# EAGLE schematic Esquema control final (EAGLE 9.7.0)
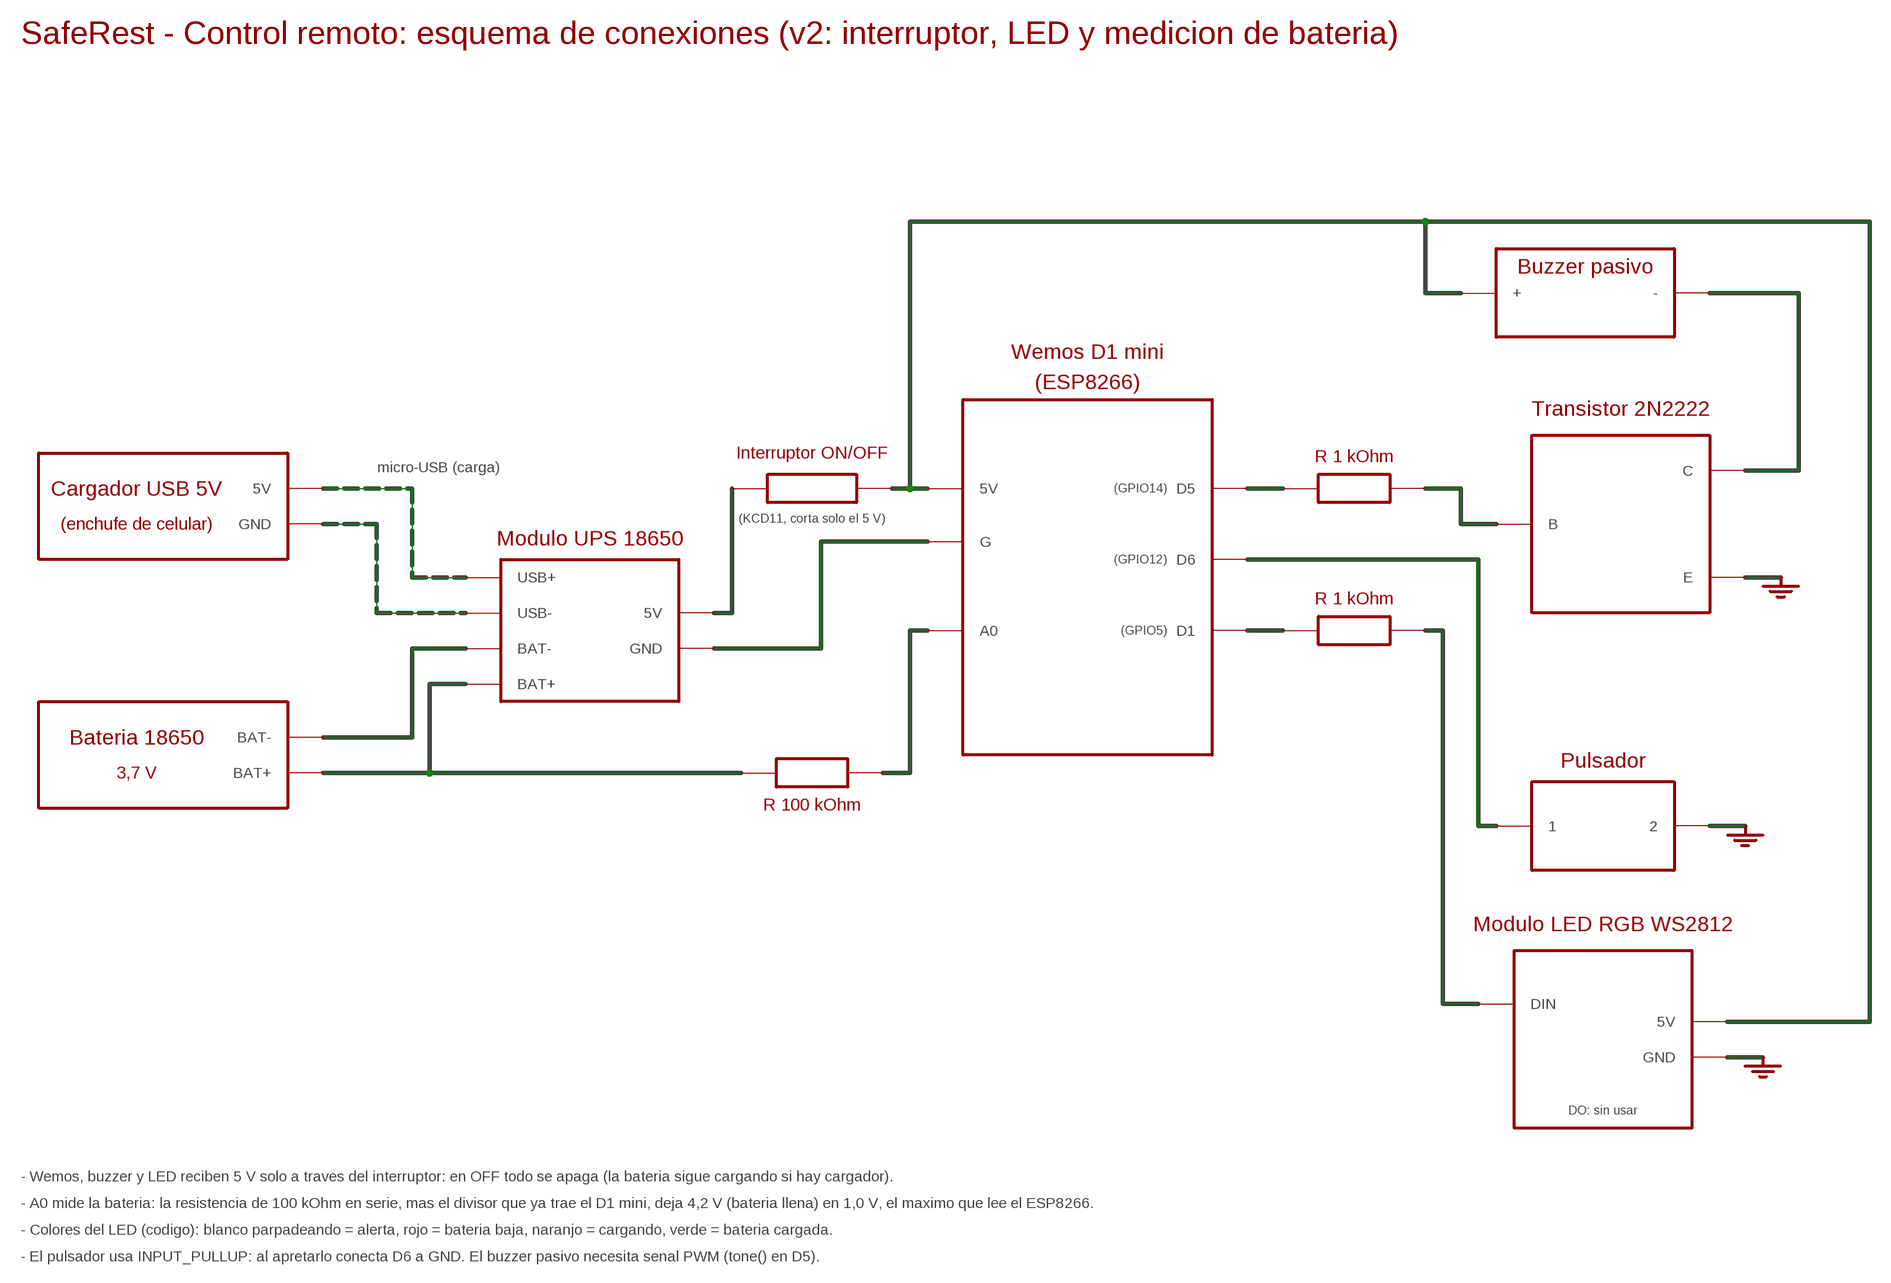
[diagram p0: schematic, sheet 1]

## Parts
BAT1  18650 3,7V  BATERIA_18650  [BATERIA_18650]
BZ1  Buzzer pasivo  BUZZER_PASIVO  [BUZZER_PASIVO]
CHG1  Cargador USB 5V  CARGADOR_USB  [CARGADOR_USB]
LED1  WS2812  LED_WS2812  [LED_WS2812]
MCU1  Wemos D1 mini  WEMOS_D1_MINI  [WEMOS_D1_MINI]
Q1  2N2222  TRANSISTOR_NPN  [TRANSISTOR_NPN]
R1  1k  RESISTENCIA  [RESISTENCIA]
R2  100k  RESISTENCIA  [RESISTENCIA]
R3  1k  RESISTENCIA  [RESISTENCIA]
S1  Pulsador  PULSADOR  [PULSADOR]
SW1  KCD11  INTERRUPTOR  [INTERRUPTOR]
UPS1  Modulo UPS 18650  MODULO_UPS  [MODULO_UPS]

## Nets
5V: BZ1.1(+) LED1.2(5V) MCU1.1(5V) SW1.2
5V_UPS: SW1.1 UPS1.5(5V)
BAT+: BAT1.2(BAT+) R2.1 UPS1.4(BAT+)
BAT-: BAT1.1(BAT-) UPS1.3(BAT-)
BOTON: MCU1.5(D6) S1.1
BUZ-: BZ1.2(-) Q1.2(C)
BUZ_PWM: MCU1.4(D5) R1.1
D1_LED: MCU1.6(D1) R3.1
GND: LED1.3(GND) MCU1.2(G) Q1.3(E) S1.2 UPS1.6(GND)
LED_DIN: LED1.1(DIN) R3.2
Q_BASE: Q1.1(B) R1.2
USB5V: CHG1.1(5V) UPS1.1(USB+)
USBGND: CHG1.2(GND) UPS1.2(USB-)
VBAT_A0: MCU1.3(A0) R2.2

## Notes on the sheet
- SafeRest - Control remoto: esquema de conexiones (v2: interruptor, LED y medicion de bateria)
- Buzzer pasivo
- Wemos D1 mini
- (ESP8266)
- Transistor 2N2222
- Interruptor ON/OFF | R 1 kOhm
- micro-USB (carga)
- Cargador USB 5V | (GPIO14)
- (KCD11, corta solo el 5 V)
- (enchufe de celular)
- Modulo UPS 18650
- (GPIO12)
- R 1 kOhm
- (GPIO5)
- Bateria 18650
- Pulsador
- 3,7 V
- R 100 kOhm
- Modulo LED RGB WS2812
- DO: sin usar
- - Wemos, buzzer y LED reciben 5 V solo a traves del interruptor: en OFF todo se apaga (la bateria sigue cargando si hay cargador).
- - A0 mide la bateria: la resistencia de 100 kOhm en serie, mas el divisor que ya trae el D1 mini, deja 4,2 V (bateria llena) en 1,0 V, el maximo que lee el ESP8266.
- - Colores del LED (codigo): blanco parpadeando = alerta, rojo = bateria baja, naranjo = cargando, verde = bateria cargada.
- - El pulsador usa INPUT_PULLUP: al apretarlo conecta D6 a GND. El buzzer pasivo necesita senal PWM (tone() en D5).

## Library data of the parts
BAT1 = SafeRest:BATERIA_18650
BZ1 = SafeRest:BUZZER_PASIVO
CHG1 = SafeRest:CARGADOR_USB
LED1 = SafeRest:LED_WS2812
MCU1 = SafeRest:WEMOS_D1_MINI
Q1 = SafeRest:TRANSISTOR_NPN
R1-R3 = SafeRest:RESISTENCIA
S1 = SafeRest:PULSADOR
SW1 = SafeRest:INTERRUPTOR
UPS1 = SafeRest:MODULO_UPS